# Altium project PCB_Project.PrjPcb
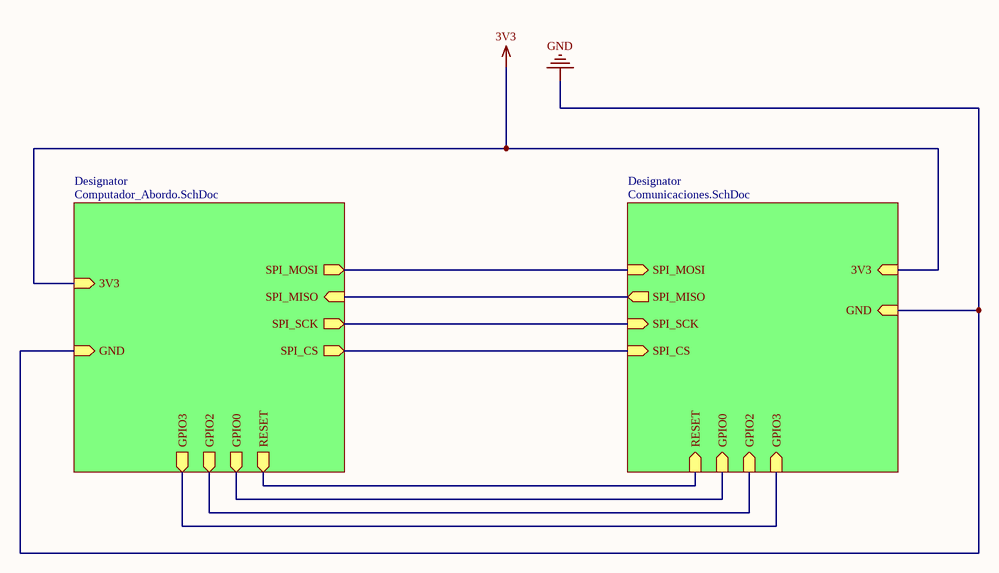
[diagram p0: Top_Sheet.SchDoc]
3 sheets, 87 parts. Net scope: hierarchical (ports join the sheet entries above them; power ports are global).
Sheets:
  Top_Sheet.SchDoc
    Designator = Computador_Abordo.SchDoc
    Designator = Comunicaciones.SchDoc

## Sheet Top_Sheet.SchDoc
size A4; SheetNumber: 1; SheetTotal: 3

### Sub-sheets
Designator = Computador_Abordo.SchDoc: SPI_CS (out), SPI_SCK (out), SPI_MISO (in), SPI_MOSI (out), RESET (out), GPIO0 (out), GPIO2 (out), GPIO3 (out), 3V3 (in), GND (in)
Designator = Comunicaciones.SchDoc: SPI_MOSI (in), SPI_MISO (out), SPI_SCK (in), SPI_CS (in), RESET (in), GPIO0 (in), GPIO2 (in), GPIO3 (in), 3V3 (in), GND (in)

### Nets
3V3: sheet Designator/3V3, sheet Designator/3V3
GND: sheet Designator/GND, sheet Designator/GND
GPIO0: sheet Designator/GPIO0, sheet Designator/GPIO0
GPIO2: sheet Designator/GPIO2, sheet Designator/GPIO2
GPIO3: sheet Designator/GPIO3, sheet Designator/GPIO3
RESET: sheet Designator/RESET, sheet Designator/RESET
SPI_CS: sheet Designator/SPI_CS, sheet Designator/SPI_CS
SPI_MISO: sheet Designator/SPI_MISO, sheet Designator/SPI_MISO
SPI_MOSI: sheet Designator/SPI_MOSI, sheet Designator/SPI_MOSI
SPI_SCK: sheet Designator/SPI_SCK, sheet Designator/SPI_SCK

## Sheet Computador_Abordo.SchDoc
size A2; SheetNumber: 2; SheetTotal: 3
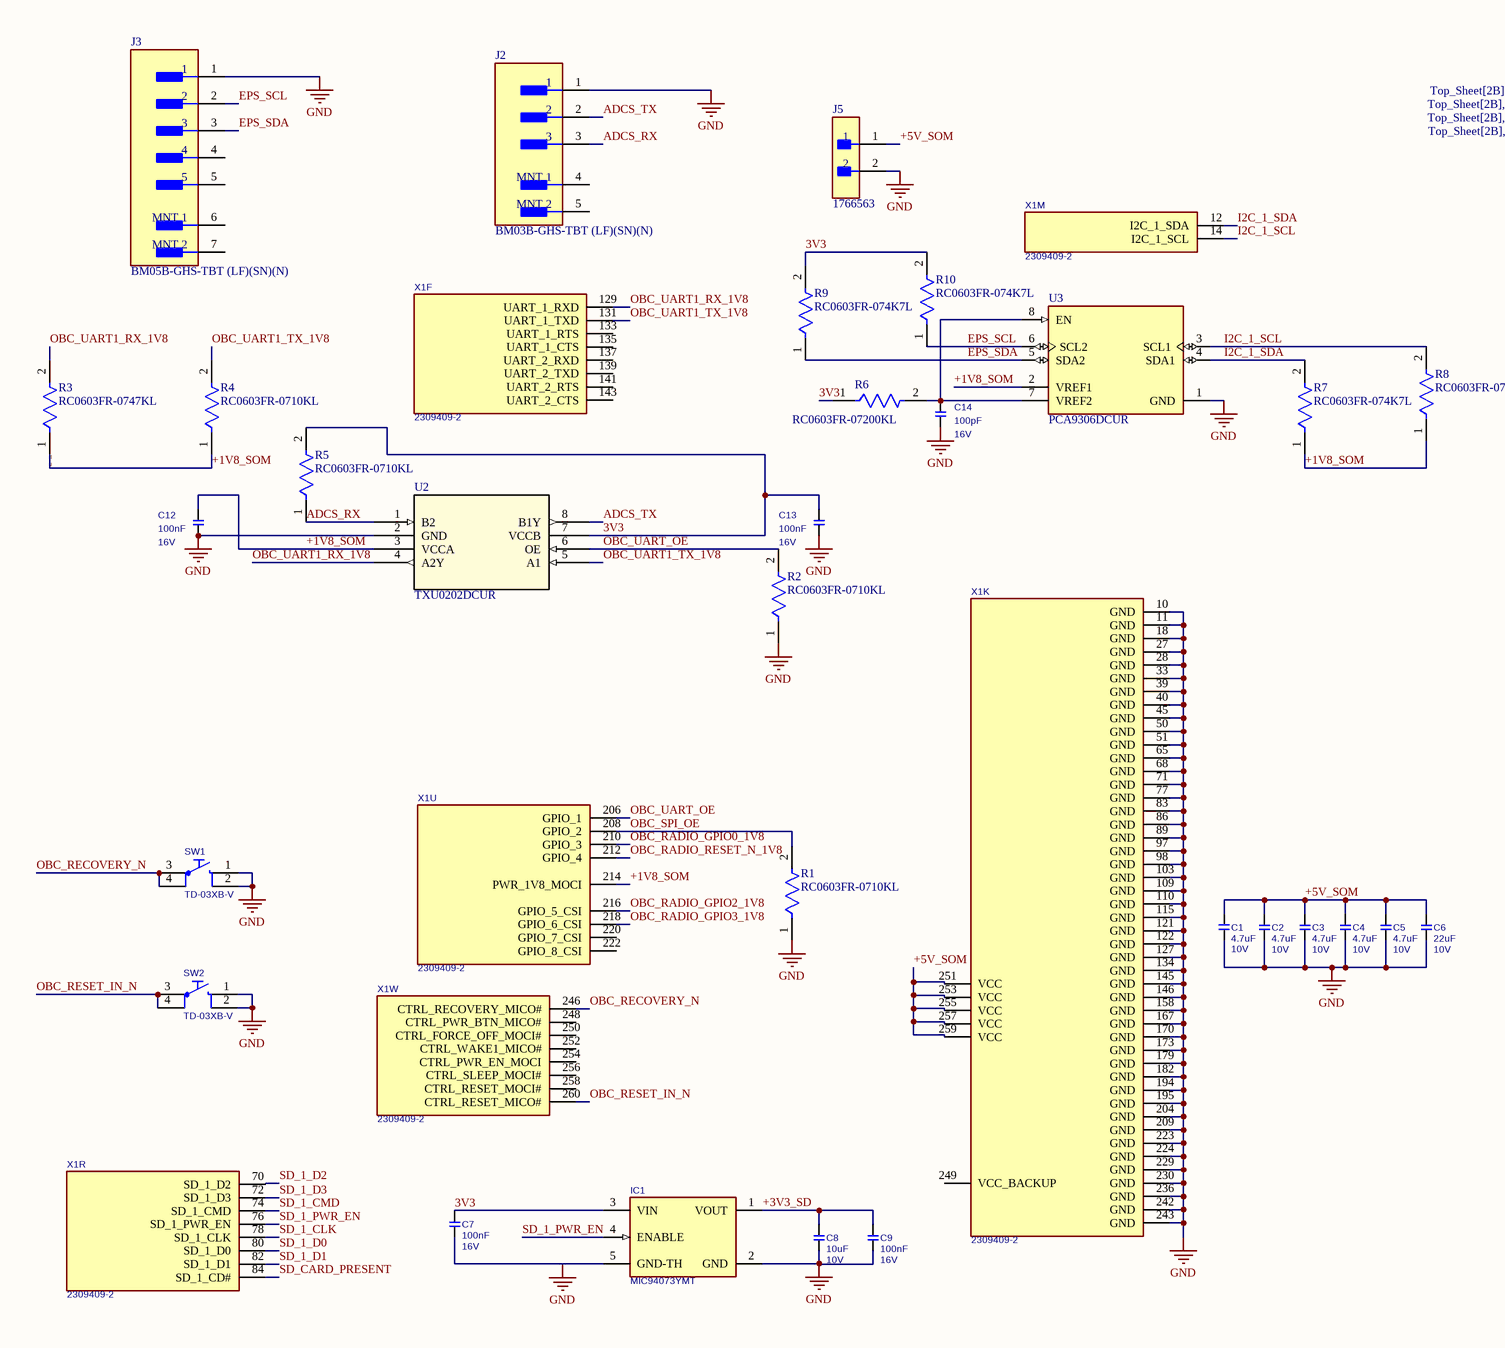
[diagram p1: Computador_Abordo.SchDoc, left]
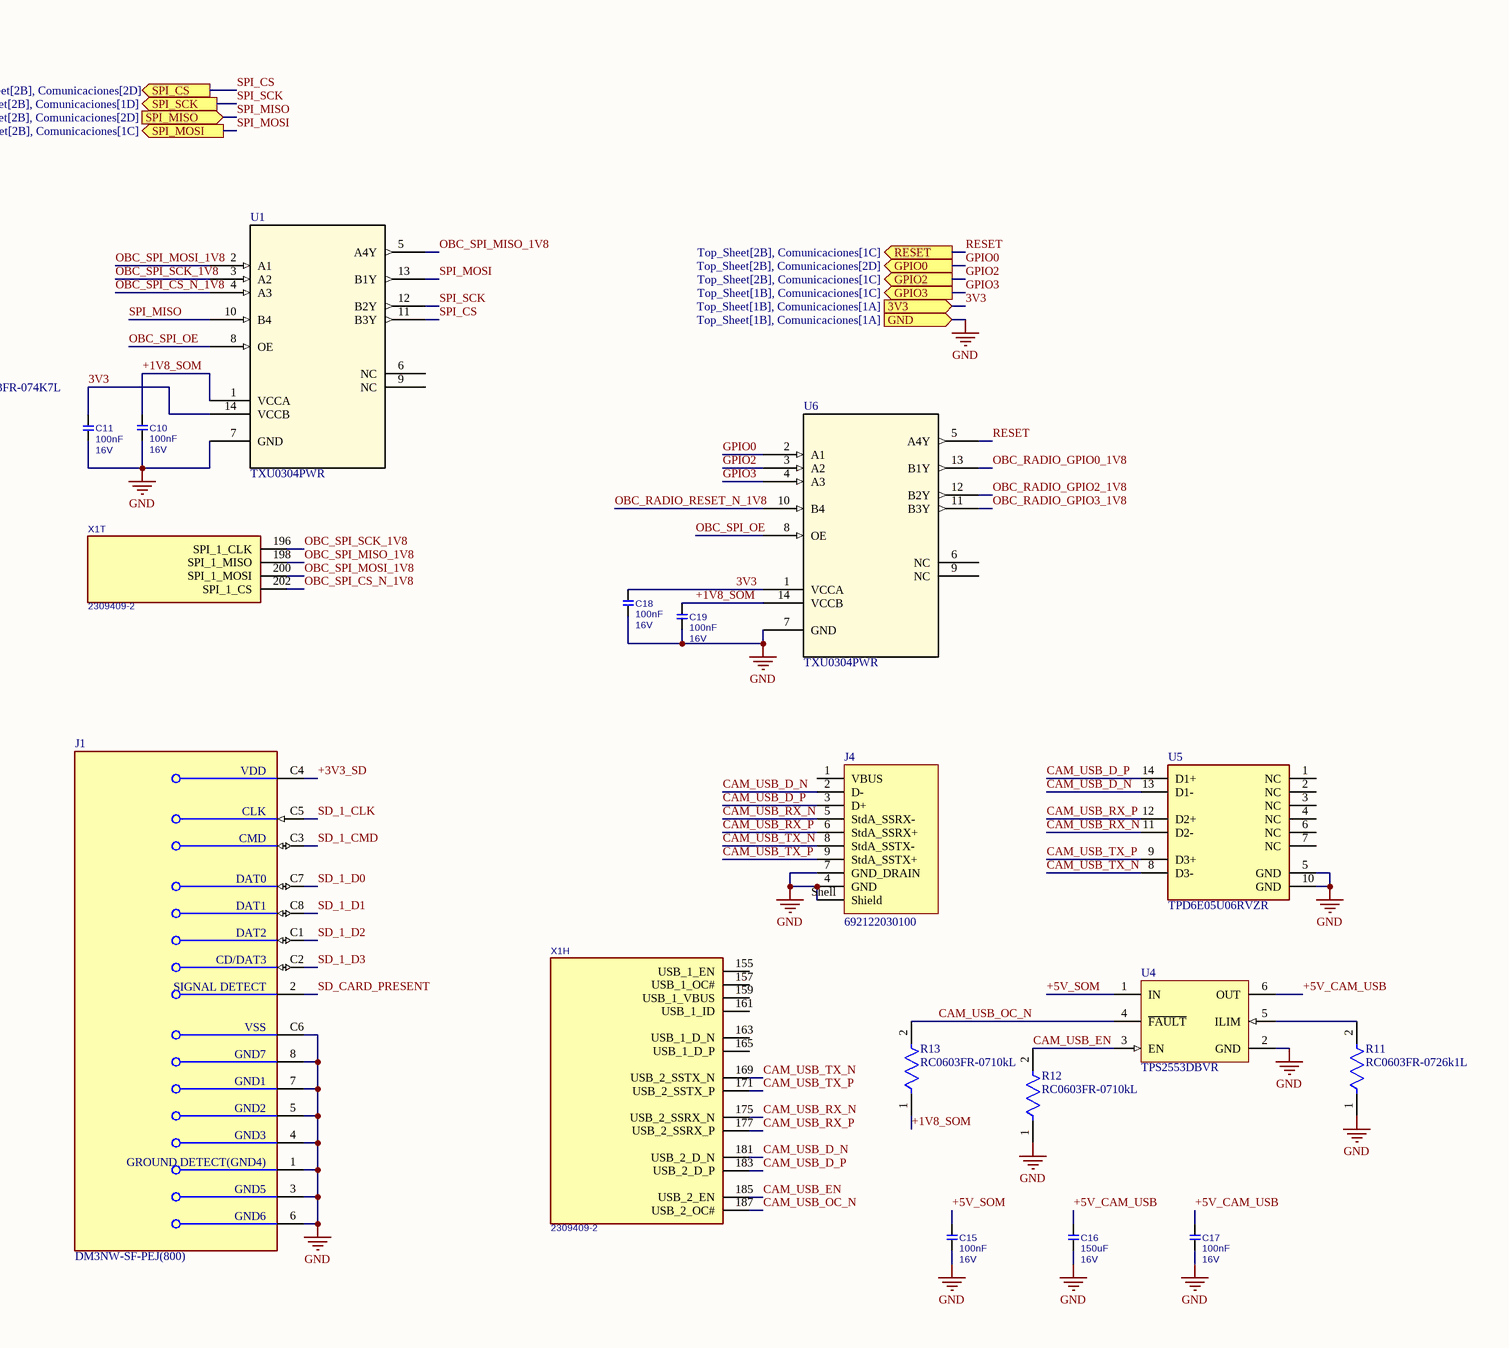
[diagram p2: Computador_Abordo.SchDoc, right]

### Parts
C1  Rating: 10V  [T_CAPC0603X33N]  (hidden comment: 4.7uF)
C2  Rating: 10V  [T_CAPC0603X33N]  (hidden comment: 4.7uF)
C3  Rating: 10V  [T_CAPC0603X33N]  (hidden comment: 4.7uF)
C4  Rating: 10V  [T_CAPC0603X33N]  (hidden comment: 4.7uF)
C5  Rating: 10V  [T_CAPC0603X33N]  (hidden comment: 4.7uF)
C6  Rating: 10V  [T_CAPC0805X125N]  (hidden comment: 22uF)
C7  Rating: 16V  [CAPC1005X60N]  (hidden comment: 100nF)
C8  Rating: 10V  [T_CAPC0603X33N]  (hidden comment: 10uF)
C9  Rating: 16V  [CAPC1005X60N]  (hidden comment: 100nF)
C10  Rating: 16V  [CAPC1005X60N]  (hidden comment: 100nF)
C11  Rating: 16V  [CAPC1005X60N]  (hidden comment: 100nF)
C12  Rating: 16V  [CAPC1005X60N]  (hidden comment: 100nF)
C13  Rating: 16V  [CAPC1005X60N]  (hidden comment: 100nF)
C14  Rating: 16V  [CAPC1005X60N]  (hidden comment: 100pF)
C15  Rating: 16V  [CAPC1005X60N]  (hidden comment: 100nF)
C16  Rating: 16V  [CAPC1005X60N]  (hidden comment: 150uF)
C17  Rating: 16V  [CAPC1005X60N]  (hidden comment: 100nF)
C18  Rating: 16V  [CAPC1005X60N]  (hidden comment: 100nF)
C19  Rating: 16V  [CAPC1005X60N]  (hidden comment: 100nF)
IC1  MIC94073YMT  [T_TDFN0P120X160X60-4N]
J1  DM3NW-SF-PEJ(800)  [FP-DM3NW-SF-PEJ_800-MFG]
J2  BM03B-GHS-TBT (LF)(SN)(N)  [FP-BM03B-GHS-TBT_LF_SN-MFG]
J3  BM05B-GHS-TBT (LF)(SN)(N)  [FP-BM05B-GHS-TBT_LF_SN-MFG]
J4  692122030100  [692122030100]
J5  1766563  [FP-1766563-MFG]
R1  RC0603FR-0710KL  [FP-RC0603-0_55-IPC_B]
R2  RC0603FR-0710KL  [FP-RC0603-0_55-IPC_B]
R3  RC0603FR-0747KL  [FP-RC0603-0_55-IPC_B]
R4  RC0603FR-0710KL  [FP-RC0603-0_55-IPC_B]
R5  RC0603FR-0710KL  [FP-RC0603-0_55-IPC_B]
R6  RC0603FR-07200KL  [FP-RC0603-0_55-IPC_B]
R7  RC0603FR-074K7L  [FP-RC0603-0_55-IPC_B]
R8  RC0603FR-074K7L  [FP-RC0603-0_55-IPC_B]
R9  RC0603FR-074K7L  [FP-RC0603-0_55-IPC_B]
R10  RC0603FR-074K7L  [FP-RC0603-0_55-IPC_B]
R11  RC0603FR-0726k1L  [FP-RC0603-0_55-IPC_B]
R12  RC0603FR-0710kL  [FP-RC0603-0_55-IPC_B]
R13  RC0603FR-0710kL  [FP-RC0603-0_55-IPC_B]
SW1  Manufacturer Part No.: TD-03XB-V  [T_WMF_TD-03XB]  (hidden comment: TD-03XB)
SW2  Manufacturer Part No.: TD-03XB-V  [T_WMF_TD-03XB]  (hidden comment: TD-03XB)
U1  TXU0304PWR  [TSSOP14_PW_TEX]
U2  TXU0202DCUR  [SO8_DCU_TEX]
U3  PCA9306DCUR  [FP-DCU0008A-MFG]
U4  TPS2553DBVR  [DBV0006A_N]
U5  TPD6E05U06RVZR  [FP-RVZ0014A-IPC_A]
U6  TXU0304PWR  [TSSOP14_PW_TEX]
X1  2309409-2  [CON-TE-2309409-2]  (parts F,H,K,M,R,T,U,W of 23)

### Ports
3V3 (in, see Top_Sheet[1B], Comunicaciones[1A]), GND (in, see Top_Sheet[1B], Comunicaciones[1A]), GPIO0 (out, see Top_Sheet[2B], Comunicaciones[2D]), GPIO2 (out, see Top_Sheet[2B], Comunicaciones[1C]), GPIO3 (out, see Top_Sheet[1B], Comunicaciones[1C]), RESET (out, see Top_Sheet[2B], Comunicaciones[1C]), SPI_CS (out, see Top_Sheet[2B], Comunicaciones[2D]), SPI_MISO (in, see Top_Sheet[2B], Comunicaciones[2D]), SPI_MOSI (out, see Top_Sheet[2B], Comunicaciones[1C]), SPI_SCK (out, see Top_Sheet[2B], Comunicaciones[1D])

### Nets
3V3: C7.2 C11.2 C13.2 C18.2 IC1.3(VIN) R5.2 R6.1 R9.2 R10.2 U1.14(VCCB) U2.7(VCCB) U6.1(VCCA) ; port 3V3
GND: C1.1 C2.1 C3.1 C4.1 C5.1 C6.1 C8.1 C9.1 C10.1 C11.1 C12.1 C13.1 C14.1 C15.1 C16.1 C17.1 C18.1 C19.1 IC1.2(GND) J1.1(GROUND_DETECT(GND4)) J1.3(GND5) J1.4(GND3) J1.5(GND2) J1.6(GND6) J1.7(GND1) J1.8(GND7) J1.C6(VSS) J2.1 J3.1 J4.4(GND) J4.7(GND_DRAIN) J4.Shell(Shield) J5.2 R1.1 R2.1 R11.1 R12.1 SW1.1 SW1.2 SW2.1 SW2.2 U1.7(GND) U2.2(GND) U3.1(GND) U4.2(GND) U5.5(GND) U5.10(GND) U6.7(GND) X1.10(GND) X1.11(GND) X1.18(GND) X1.27(GND) X1.28(GND) X1.33(GND) X1.39(GND) X1.40(GND) X1.45(GND) X1.50(GND) X1.51(GND) X1.65(GND) X1.68(GND) X1.71(GND) X1.77(GND) X1.83(GND) X1.86(GND) X1.89(GND) X1.97(GND) X1.98(GND) X1.103(GND) X1.109(GND) X1.110(GND) X1.115(GND) X1.121(GND) X1.122(GND) X1.127(GND) X1.134(GND) X1.145(GND) X1.146(GND) X1.158(GND) X1.167(GND) X1.170(GND) X1.173(GND) X1.179(GND) X1.182(GND) X1.194(GND) X1.195(GND) X1.204(GND) X1.209(GND) X1.223(GND) X1.224(GND) X1.229(GND) X1.230(GND) X1.236(GND) X1.242(GND) X1.243(GND) ; port GND
+1V8_SOM: C10.2 C12.2 C19.2 R3.1 R4.1 R7.1 R8.1 R13.1 U1.1(VCCA) U2.3(VCCA) U3.2(VREF1) U6.14(VCCB) X1.214(PWR_1V8_MOCI)  [also labelled |]
+3V3_SD: C8.2 C9.2 IC1.1(VOUT) J1.C4(VDD)
+5V_CAM_USB: C16.2 C17.2 U4.6(OUT)
+5V_SOM: C1.2 C2.2 C3.2 C4.2 C5.2 C6.2 C15.2 J5.1 U4.1(IN) X1.251(VCC) X1.253(VCC) X1.255(VCC) X1.257(VCC) X1.259(VCC)
ADCS_RX: J2.3 R5.1 U2.1(B2)
ADCS_TX: J2.2 U2.8(B1Y)
CAM_USB_D_N: J4.2(D-) U5.13(D1-) X1.181(USB_2_D_N)
CAM_USB_D_P: J4.3(D+) U5.14(D1+) X1.183(USB_2_D_P)
CAM_USB_EN: R12.2 U4.3(EN) X1.185(USB_2_EN)
CAM_USB_OC_N: R13.2 U4.4(~{FAULT}) X1.187(USB_2_OC#)
CAM_USB_RX_N: J4.5(StdA_SSRX-) U5.11(D2-) X1.175(USB_2_SSRX_N)
CAM_USB_RX_P: J4.6(StdA_SSRX+) U5.12(D2+) X1.177(USB_2_SSRX_P)
CAM_USB_TX_N: J4.8(StdA_SSTX-) U5.8(D3-) X1.169(USB_2_SSTX_N)
CAM_USB_TX_P: J4.9(StdA_SSTX+) U5.9(D3+) X1.171(USB_2_SSTX_P)
EPS_SCL: J3.2 R10.1 U3.6(SCL2)
EPS_SDA: J3.3 R9.1 U3.5(SDA2)
GPIO0: U6.2(A1) ; port GPIO0
GPIO2: U6.3(A2) ; port GPIO2
GPIO3: U6.4(A3) ; port GPIO3
I2C_1_SCL: R8.2 U3.3(SCL1) X1.14(I2C_1_SCL)
I2C_1_SDA: R7.2 U3.4(SDA1) X1.12(I2C_1_SDA)
OBC_RADIO_GPIO0_1V8: U6.13(B1Y) X1.210(GPIO_3)
OBC_RADIO_GPIO2_1V8: U6.12(B2Y) X1.216(GPIO_5_CSI)
OBC_RADIO_GPIO3_1V8: U6.11(B3Y) X1.218(GPIO_6_CSI)
OBC_RADIO_RESET_N_1V8: U6.10(B4) X1.212(GPIO_4)
OBC_RECOVERY_N: SW1.3 SW1.4 X1.246(CTRL_RECOVERY_MICO#)
OBC_RESET_IN_N: SW2.3 SW2.4 X1.260(CTRL_RESET_MICO#)
OBC_SPI_CS_N_1V8: U1.4(A3) X1.202(SPI_1_CS)
OBC_SPI_MISO_1V8: U1.5(A4Y) X1.198(SPI_1_MISO)
OBC_SPI_MOSI_1V8: U1.2(A1) X1.200(SPI_1_MOSI)
OBC_SPI_OE: R1.2 U1.8(OE) U6.8(OE) X1.208(GPIO_2)
OBC_SPI_SCK_1V8: U1.3(A2) X1.196(SPI_1_CLK)
OBC_UART1_RX_1V8: R3.2 U2.4(A2Y) X1.129(UART_1_RXD)
OBC_UART1_TX_1V8: R4.2 U2.5(A1) X1.131(UART_1_TXD)
OBC_UART_OE: R2.2 U2.6(OE) X1.206(GPIO_1)
RESET: U6.5(A4Y) ; port RESET
SD_1_CLK: J1.C5(CLK) X1.78(SD_1_CLK)
SD_1_CMD: J1.C3(CMD) X1.74(SD_1_CMD)
SD_1_D0: J1.C7(DAT0) X1.80(SD_1_D0)
SD_1_D1: J1.C8(DAT1) X1.82(SD_1_D1)
SD_1_D2: J1.C1(DAT2)
SD_1_D3: J1.C2(CD/DAT3) X1.72(SD_1_D3)
SD_1_PWR_EN: IC1.4(ENABLE) X1.76(SD_1_PWR_EN)
SD_CARD_PRESENT: J1.2(SIGNAL_DETECT) X1.84(SD_1_CD#)
SPI_CS: U1.11(B3Y) ; port SPI_CS
SPI_MISO: U1.10(B4) ; port SPI_MISO
SPI_MOSI: U1.13(B1Y) ; port SPI_MOSI
SPI_SCK: U1.12(B2Y) ; port SPI_SCK
NetC7_1: C7.1 IC1.5(GND-TH)
NetC14_2: C14.2 R6.2 U3.7(VREF2) U3.8(EN)
NetR11_2: R11.2 U4.5(ILIM)

Not connected (* = marked no-connect by the designer): J2 4(MNT_1) 5(MNT_2); J3 4 5 6(MNT_1) 7(MNT_2); J4 1(VBUS); U1 6(NC) 9(NC); U5 1(NC) 2(NC) 3(NC) 4(NC) 6(NC) 7(NC); U6 6(NC) 9(NC); X1 70(SD_1_D2) 133(UART_1_RTS) 135(UART_1_CTS) 137(UART_2_RXD) 139(UART_2_TXD) 141(UART_2_RTS) 143(UART_2_CTS) 155(USB_1_EN) 157(USB_1_OC#) 159(USB_1_VBUS) 161(USB_1_ID) 163(USB_1_D_N) 165(USB_1_D_P) 220(GPIO_7_CSI) 222(GPIO_8_CSI) 248(CTRL_PWR_BTN_MICO#) 249(VCC_BACKUP) 250(CTRL_FORCE_OFF_MOCI#) 252(CTRL_WAKE1_MICO#) 254(CTRL_PWR_EN_MOCI) 256(CTRL_SLEEP_MOCI#) 258(CTRL_RESET_MOCI#)

### Notes on the sheet
- Labels drawn without touching a wire or pin: GND

### Library data of the parts
C1-C5 = C-X5R-4.7uF-10V-10%-0603: Capacitor Ceramic X5R 4.7uF 10V 10% 0603; Tolerance: 10%; Type: X5R; Value: 4.7uF
C6 = C-X5R-22uF-10V-20%-0805: Capacitor Ceramic X5R 22uF 10V 20% 0805; Tolerance: 20%; Type: X5R; Value: 22uF
C7 C9-C19 = C-X7R-100nF-16V-10%-0402: Capacitor Ceramic X7R 100nF 16V 10% 0402; Tolerance: 10%; Type: X7R
  C7 C9-C13 C15 C17-C19: Value: 100nF
  C14: Value: 100pF
  C16: Value: 150uF
C8 = C-X5R-10uF-10V-20%-0603: Capacitor Ceramic X5R 10uF 10V 20% 0603; Tolerance: 20%; Type: X5R; Value: 10uF
IC1 = IC-Microchip-MIC94073YMT: High Side Load Switch, TDFN4 1.2 x 1.6; Manufacturer Name: Microchip; Package: TDFN-4; Manufacturer Part No.: MIC94073YMT
J1 = CMP-11597-000007-1: CONN MICROSD CARD PUSH-PUSH SMD; RoHS Compliant: Yes
J2 = CMP-17439-000616-1: CONN HEADER SMD 3POS 1.25MM; Mated Stacking Heights: 7.3mm; Voltage Rating: 50V; Pitch: 0.049inch; Number of Positions: 3; Contact Material: Bronze; Number of Rows: 1; Packaging: Cut Tape; Fastening Type: Ramp; Contact Shape: Rectangular; Termination: Solder; Flammability Rating: UL94 V-0; Lead Free: Lead Free; Color: Natural; Mount: Surface Mount; Contact Finish - Mating: TIN; Max Operating Temperature: 85°C; Series: GH; Insulation Color: Natural; Connector Type: Header; Insulation Material: Nylon; Contact Type: Outer Shroud Contact; Min Operating Temperature: -25°C; Contact Plating: Tin
J3 = CMP-17439-000467-1: CONN HEADER SMD 5POS 1.25MM; Pitch: 0.049inch; Number of Positions: 5; Mated Stacking Heights: 7.3mm; Voltage Rating: 50V; Contact Material: Bronze; Number of Pins: 5; Contact Type: Outer Shroud Contact; Lead Free: Lead Free; Insulation Material: Nylon; Flammability Rating: UL94 V-0; Min Operating Temperature: -25°C; Series: GH; Mount: Surface Mount; Number of Rows: 1; Color: Natural; Packaging: Cut Tape; Contact Shape: Rectangular; Contact Plating: Tin; Contact Finish - Mating: TIN; Connector Type: Header; Insulation Color: Natural; Fastening Type: Ramp; Termination: Solder; Max Operating Temperature: 85°C
J4 = CMP-1502-03220-3: Conn USB 3.0 Type A RCP 9 POS 1.25mm Solder RA SMD 9 Terminal 1 Port T/R; Current Rating: 250mA; Insulation Resistance: 100MΩ; Number of Contacts: 9; Number of Ports: 1; Voltage Rating (AC): 30V; USB Standard: USB 3.0; Gender: Receptacle; Contact Resistance: 50mΩ; RoHS: Compliant; Min Operating Temperature: -20°C; Packaging: Tape and Reel; Width: 16.66mm; Contact Plating: Gold; Color: Blue; Height: 8.01mm; Mount: Horizontal, Surface Mount, Through Hole; Voltage Rating: 30V; Contact Material: Gold, Nickel; Connector Type: USB; REACH SVHC: Unknown; Number of Pins: 9; Max Operating Temperature: 85°C; Operating Supply Voltage: 30V; Lead Free: Lead Free; Termination: SMD/SMT; Orientation: Horizontal; Flammability Rating: UL94 V-0; Features: Shielded; Length: 15.1mm
J5 = CMP-09399-000002-1: TERM BLOCK HDR 2POS VERT 7.62MM; Manufacturer: Phoenix Contact; Conn Gender: Male; Number Of Contacts: 2; Conn Orientation: Straight; Voltage Rating: 630V; Current Rating: 12A; Package: 1766563; Device Class L3: unset; Pitch: 7.62mm; Contact Material: Tin; Height: 12.15mm; Digikey Description: TERM BLOCK HDR 2POS VERT 7.62MM; RoHS: TRUE; Category: Conn; Octopart: https://octopart.com/1766563-phoenix+contact-859397; Lead Free: Yes; Number Of Rows: 1; Footprint Url: https://www.phoenixcontact.com/online/portal/us/pxc/product_detail_page/!ut/p/z1/3Vffc6IwEP5X7INvjVkCBLyZe8AftfaqtVVb4YUJIdrcCVhAbfvXX1B753hz-tBx5g4mA0l299vsJl9mwR6eYC9mKzljuUxiNldj16P-qDFqtweEanf3ZgO6LbPZvjUetOs-wY_Yw17OAuxqRW8ug5Slb9hdZiIuJhYyVCKLUpPqxTiZDprNb9gdIE1DQNR7AyDzucDulRAhyp_TZDl7rjwLFoq0giqd3nDUeKyQS7MKFYI6yLqkRM1_oD4dXaOjHBwPYWsPf3kcOGXvKnvLJx0NtGtD68GtZcE9uXIIaQ2cEWh4uElEOJ2zeLZkMxXoZiLJZJHl7SgVXMiVSHcyzn8c5ujP1KZJuOQFxEi85lvD3zuh_EVJ-OHrYBd2pi2RMznPurmIunsKJwLSSxZQB8oWEClbQGXjUKdsHLLLxiG7bByyy8ahu9IdubJdCnf0vwtIKSxTid3FK0cJR1KJw43mF4Xz9UPrBnsyiGprHtWgplRrO1B_q-svikifGtgdayKerVWF6R0tIh1tp3CkCB2K2B8P_cGkOR4ez3vrgeKnlRRrPI6TNFJV_HYXeJGJEGwQBliIhcREhkUEYlDnKIC6YQvDmBIw8TWc8mB-0sMJeOus8NZ54fvnTc6VcV74z67-5uhRvzWKf0r5_eXFc7DHkzgvCDwpiF2FtQiqEDGpujtGZVWYyyzfMEr1FzzwlU0seJ6kmb_4dUtUIeSmbTFqocA0ABmUUsQIGEgInQR0aml63caLKLL1oqHx5H0kgve9ZoO-E26b3--bq_32Dxr0kVfvok4zsHtt3ZxF_sEncy4ufgLJYhWE/p0/IZ7_2G101H41M0L770Q2FA22DPAT82=CZ6_TBTEEP261OQ5B0ID5CEL4R1HN2=LA0=EdownloadId!4187324=action!downloadFile==/#Z7_2G1; Device Class L1: Connectors; Automotive: No; ComponentLink2Description: Datasheet; ComponentLink2URL: https://www.phoenixcontact.com/pxc-oc-itemdetail-pdf-web/eshop?lineItemType=LineItem&UID=1766563; Device Class L2: Headers and Wire Housings; Manufacturer Part Number: 1766563; Mouser Description: Pluggable Terminal Blocks 2 Pos 7.62mm pitch Through Hole Header
R1-R13 = CMP-2100-03664-2: RES 10K OHM 1% 1/10W 0603; Voltage Rating: 75V; Voltage Rating (DC): 50V; Resistance: 10kR; Power Rating: 100mW; Temperature Coefficient: 100ppm/°C; Depth: 0.8mm; Termination: SMD/SMT; Resistor Type: Thick Film; Series: RC; Construction: Rectangular; Features: Moisture Resistant; Packaging: Tape and Reel; Min Operating Temperature: -55°C; Number of Terminations: 2; Lead Pitch: 0.3mm; RoHS Compliant: Yes; Case/Package: 0603; Resistance Tolerance: 1%; Military Standard: Not; Weight: 7.1E-05oz; Number of Pins: 2; Tolerance: 1%; Length: 1.6mm; Case Code (Imperial): 0603; Lead Free: Lead Free; Width: 0.8mm; Max Power Dissipation: 100mW; Height: 0.45mm; Max Operating Temperature: 155°C; Case Code (Metric): 1608; Size Code: 0603
SW1 SW2 = SW-WMF-TD-03XB: Push Button; Manufacturer Name: Wealth Metal; Rating: 50mA
U1 U6 = TXU0304PWR: Four-channel fixed multidirectional level shifter 14-TSSOP -40 to 125; Manufacturer_Name: Texas Instruments; Copyright: Copyright (C) 2026 Ultra Librarian. All rights reserved.; Manufacturer_Part_Number: TXU0304PWR; RefDes: RefDes; Type: Type
U2 = TXU0202DCUR: Two channel fixed-direction level shifter with channels in opposite direction 8-VSSOP -40 to 125; Manufacturer_Name: Texas Instruments; Copyright: Copyright (C) 2026 Ultra Librarian. All rights reserved.; Manufacturer_Part_Number: TXU0202DCUR; RefDes: RefDes; Type: Type
U3 = CMP-0314-00419-3: IC TRNSLTR BIDIRECTIONAL 8VSSOP; Output Type: I2C; Max Supply Voltage: 5V; Number of Outputs: 2; Min Supply Voltage: 0uV; Logic Function: Translator; Turn-On Delay Time: 1.2ns; Output Current: 64mA; Propagation Delay: 1.4ns; Height: 0.85mm; Case/Package: VSSOP; Min Operating Temperature: -40°C; Weight: 0.000339oz; Packaging: Tape and Reel; Number of Pins: 8; Package Quantity: 1; Contact Plating: Gold; Termination: SMD/SMT; Max Operating Temperature: 85°C; Radiation Hardening: No; Number of Bits: 2; REACH SVHC: No SVHC; Lead Free: Lead Free; Number of Channels: 2; Length: 2.3mm; Number of Inputs: 2; Width: 2mm
U4 = CMP-0337-00284-2: Adjustable, Active High, Constant-Current, Current-Limited Power-Distribution Switch, 0.075 to 1.7 A Current Limit, -40 to 85 degC, 6-pin SOT-23 (DBV), Green (RoHS & no Sb/Br); Manufacturer: Texas Instruments; Continuous Current(Max)(A): 1.5; Vin(Min)(V): 2.5; Current Limit Accuracy @ 1A: +/-7.5% (925mA min / 1075mA max); Vin(Max)(V): 6.5; Rating: Catalog; rDS(on) per FET(Typ)(mOhms): 100/DRV, 85/DBV; Number of Switches: 1; ComponentLink1Description: Datasheet; PartNumber: TPS2553DBVR; Enable: Active High; PackageDescription: 6-Pin Plastic Small-Outline Package, 2.9 x 1.6 mm Body, 0.95 mm Pitch, 2.8 mm Lead Span; DatasheetVersion: SLVS841E; Code_JEDEC: MO-178-AB*; Current Limit Topology: Constant-Current; Mounting Technology: Surface Mount; Eco-Plan: Green (RoHS & no Sb/Br); PackageVersion: revK, Mar-2006; PackageReference: DBV0006A; ComponentLink1URL: http://www.ti.com/general/docs/lit/getliterature.tsp?genericPartNumber=TPS2553&fileType=pdf; Current Limit(A): 0.075 to 1.7
U5 = CMP-04985-000017-1: TVS DIODE 5.5V 14V 14USON; Number of Channels: 6; Peak Pulse Current: 2.5A; Polarity: Bidirectional; Interface: LVDS; Leakage Current: 10nA; Direction: Unidirectional; Power Line Protection: Yes; Breakdown Voltage: 6V; Max Power Dissipation: 40W; Min Operating Temperature: -40°C; Working Voltage: 5.5V; Number of Pins: 14; Termination: SMD/SMT; Number of Bidirectional Channels: 6; Reverse Standoff Voltage: 5.5V; Package Quantity: 3000; Mount: Surface Mount; Max Operating Temperature: 125°C; Radiation Hardening: No; Length: 3.6mm; RoHS Compliant: Yes; Lead Free: Lead Free; Packaging: Tape and Reel; Min Breakdown Voltage: 6V; Clamping Voltage: 14V; Peak Pulse Power: 40W; Depth: 1.45mm
X1 = CON-TE-2309409-2: DDR4 SODIMM Socket, 260 pins, 5.2mm(H), 0.5mm Pitch; Manufacturer Name: TE Connectivity; Manufacturer Part No.: 2309409-2; Temperature Range: -40C to +125C; Package: DDR4-SODIMM-260

## Sheet Comunicaciones.SchDoc
size A4; SheetNumber: 3; SheetTotal: 3
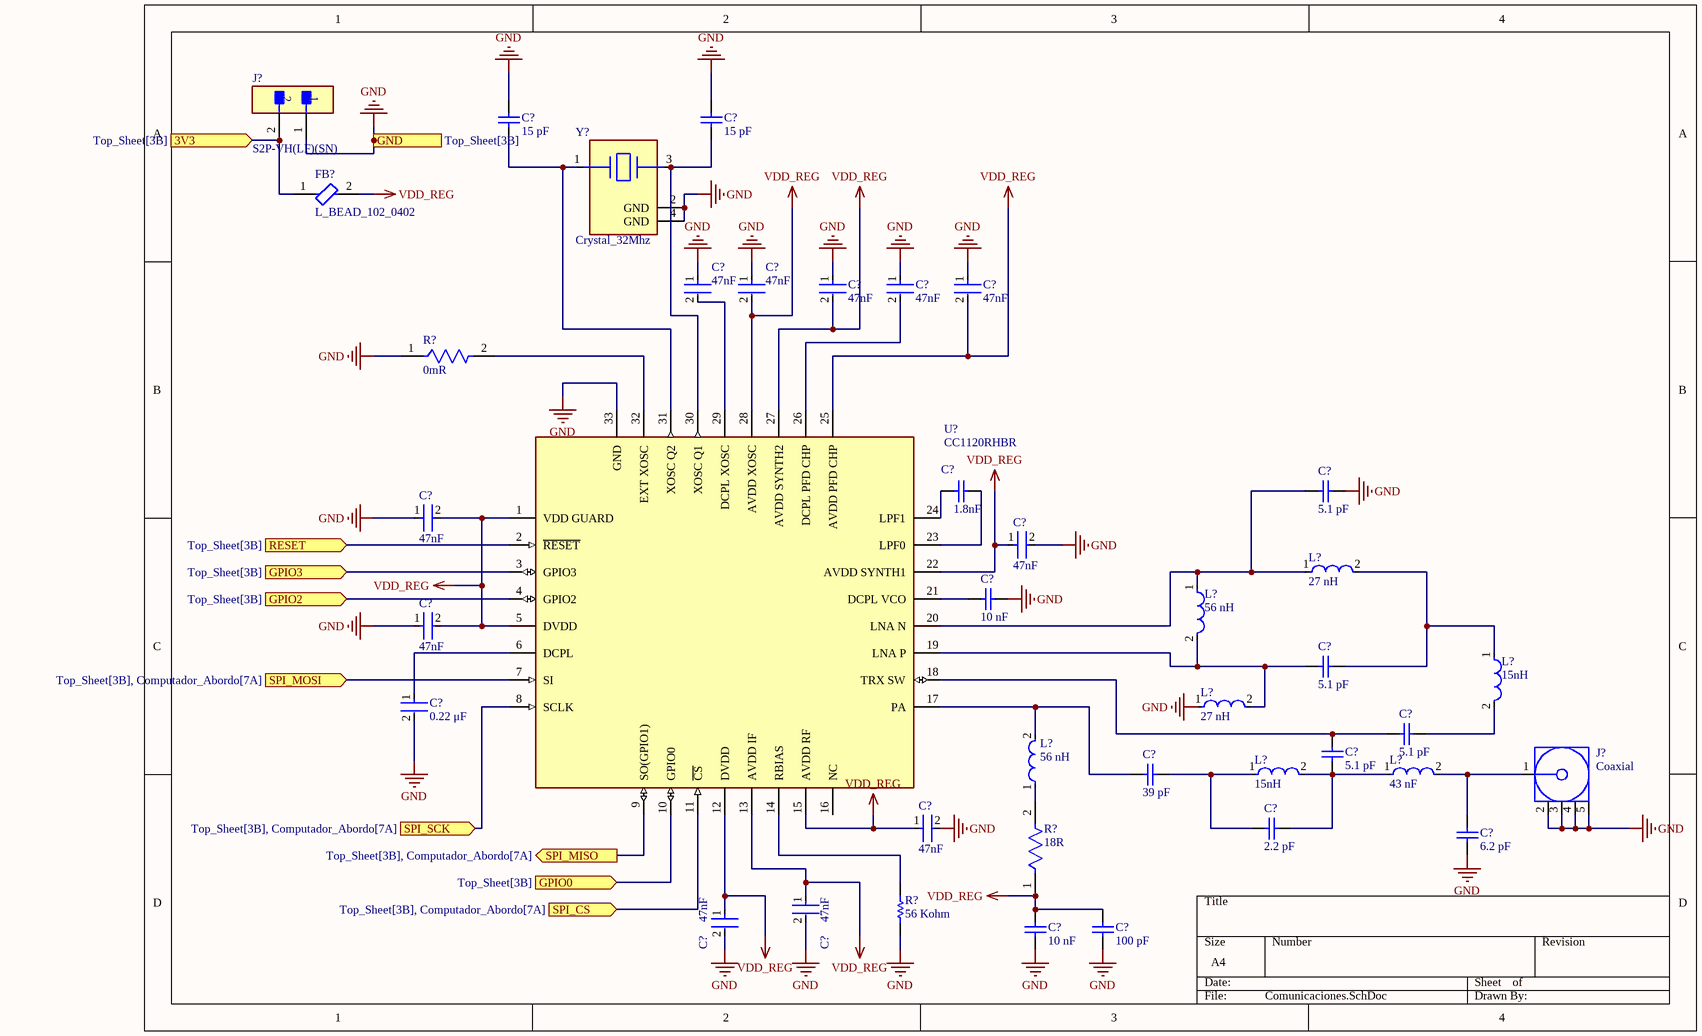
[diagram p3: Comunicaciones.SchDoc]

### Parts
(Parts that share a designator on the sheet are numbered #1, #2 ... from top to bottom, then left to right.)
C?#1  15 pF  [CAPC1005X55X25LL05T10]
C?#2  15 pF  [CAPC1005X55X25LL05T10]
C?#3  47nF  [FP-GRM155-0_05-IPC_A]
C?#4  47nF  [FP-GRM155-0_05-IPC_A]
C?#5  47nF  [FP-GRM155-0_05-IPC_A]
C?#6  47nF  [FP-GRM155-0_05-IPC_A]
C?#7  47nF  [FP-GRM155-0_05-IPC_A]
C?#8  1.8nF  [CAPC1005X55X25LL05T10]
C?#9  5.1 pF  [CAPC1005X55X25LL05T10]
C?#10  47nF  [FP-GRM155-0_05-IPC_A]
C?#11  47nF  [FP-GRM155-0_05-IPC_A]
C?#12  10 nF  [CAPC1005X55X25LL05T10]
C?#13  47nF  [FP-GRM155-0_05-IPC_A]
C?#14  5.1 pF  [CAPC1005X55X25LL05T10]
C?#15  0.22 μF  [FP-C0603C-CF-IPC_B]
C?#16  5.1 pF  [CAPC1005X55X25LL05T10]
C?#17  5.1 pF  [CAPC1005X55X25LL05T10]
C?#18  39 pF  [CAPC1005X55X25LL05T10]
C?#19  2.2 pF  [CAPC1005X55X25LL05T10]
C?#20  47nF  [FP-GRM155-0_05-IPC_A]
C?#21  6.2 pF  [CAPC1005X60X25ML10T15]
C?#22  47nF  [FP-GRM155-0_05-IPC_A]
C?#23  47nF  [FP-GRM155-0_05-IPC_A]
C?#24  100 pF  [CAPC1005X55X25LL05T10]
C?#25  10 nF  [CAPC1005X55X25LL05T10]
FB?  L_BEAD_102_0402  [FP-BLM15-0_05-IPC_C]
J?#1  S2P-VH(LF)(SN)  [FP-S2P-VH_LF_SN-MFG]
J?#2  Coaxial  [60312202114512]
L?#1  27 nH  [FP-LQW15AN_00-W0_5-0_1-MFG]
L?#2  56 nH  [FP-LQW15AN_00-W0_5-0_1-MFG]
L?#3  15nH  [FP-LQW15AN_00-W0_6-0_1-MFG]
L?#4  27 nH  [FP-LQW15AN_00-W0_5-0_1-MFG]
L?#5  15nH  [FP-LQW15AN_00-W0_6-0_1-MFG]
L?#6  43 nF  [FP-LQW15AN_00-W0_5-0_1-MFG]
L?#7  56 nH  [FP-LQW15AN_00-W0_5-0_1-MFG]
R?#1  0mR  [FP-RK73Z1E-IPC_B]
R?#2  18R  [FP-RMCF0402-IPC_B]
R?#3  56 Kohm  [RESC1005X40X25ML10T10]
U?  CC1120RHBR  [FP-RHB0032E-MFG]
Y?  Crystal_32Mhz  [FP-ABM10W-MFG]

### Ports
3V3 (in, see Top_Sheet[3B]), GND (in, see Top_Sheet[3B]), GPIO0 (in, see Top_Sheet[3B]), GPIO2 (in, see Top_Sheet[3B]), GPIO3 (in, see Top_Sheet[3B]), RESET (in, see Top_Sheet[3B]), SPI_CS (in, see Top_Sheet[3B], Computador_Abordo[7A]), SPI_MISO (out, see Top_Sheet[3B], Computador_Abordo[7A]), SPI_MOSI (in, see Top_Sheet[3B], Computador_Abordo[7A]), SPI_SCK (in, see Top_Sheet[3B], Computador_Abordo[7A])

### Nets
3V3: FB?.1 J?#1.2 ; port 3V3
GND: C?#1.2 C?#2.2 C?#3.1 C?#4.1 C?#5.1 C?#6.1 C?#7.1 C?#9.1 C?#10.1 C?#11.2 C?#12.2 C?#13.1 C?#15.2 C?#20.2 C?#21.1 C?#22.2 C?#23.2 C?#24.2 C?#25.1 J?#1.1 J?#2.2(GND) J?#2.3(GND) J?#2.4(GND) J?#2.5(GND) L?#4.1 R?#1.1 R?#3.1 U?.33(GND) Y?.2(GND) Y?.4(GND) ; port GND
VDD_REG: C?#4.2 C?#5.2 C?#7.2 C?#10.2 C?#11.1 C?#13.2 C?#20.1 C?#22.1 C?#23.1 C?#24.1 C?#25.2 FB?.2 R?#2.1 U?.1(VDD_GUARD) U?.5(DVDD) U?.12(DVDD) U?.13(AVDD_IF) U?.15(AVDD_RF) U?.22(AVDD_SYNTH1) U?.25(AVDD_PFD_CHP) U?.27(AVDD_SYNTH2) U?.28(AVDD_XOSC)
GPIO0: U?.10(GPIO0) ; port GPIO0
GPIO2: U?.4(GPIO2) ; port GPIO2
GPIO3: U?.3(GPIO3) ; port GPIO3
RESET: U?.2(~{RESET}) ; port RESET
SPI_CS: U?.11(~{CS}) ; port SPI_CS
SPI_MISO: U?.9(SO(GPIO1)) ; port SPI_MISO
SPI_MOSI: U?.7(SI) ; port SPI_MOSI
SPI_SCK: U?.8(SCLK) ; port SPI_SCK
NetC?#1_1: C?#1.1 U?.31(XOSC_Q2) Y?.1
NetC?#2_1: C?#2.1 U?.30(XOSC_Q1) Y?.3
NetC?#3_2: C?#3.2 U?.29(DCPL_XOSC)
NetC?#6_2: C?#6.2 U?.26(DCPL_PFD_CHP)
NetC?#8_1: C?#8.1 U?.23(LPF0)
NetC?#8_2: C?#8.2 U?.24(LPF1)
NetC?#9_2: C?#9.2 L?#1.1 L?#2.1 U?.20(LNA_N)
NetC?#12_1: C?#12.1 U?.21(DCPL_VCO)
NetC?#14_1: C?#14.1 L?#1.2 L?#3.1
NetC?#14_2: C?#14.2 L?#2.2 L?#4.2 U?.19(LNA_P)
NetC?#15_1: C?#15.1 U?.6(DCPL)
NetC?#16_1: C?#16.1 C?#17.2 U?.18(TRX_SW)
NetC?#16_2: C?#16.2 C?#19.2 L?#5.2 L?#6.1
NetC?#17_1: C?#17.1 L?#3.2
NetC?#18_1: C?#18.1 L?#7.2 U?.17(PA)
NetC?#18_2: C?#18.2 C?#19.1 L?#5.1
NetC?#21_2: C?#21.2 J?#2.1(Signal) L?#6.2
NetL?#7_1: L?#7.1 R?#2.2
NetR?#1_2: R?#1.2 U?.32(EXT_XOSC)
NetR?#3_2: R?#3.2 U?.14(RBIAS)

Not connected (* = marked no-connect by the designer): U? 16(NC)

### Library data of the parts
C?#1 C?#2 = C_15P_0402_NP0_J_50: Part Number: GRM1555C1H150JZ01D; Manufacturer: Murata; Value: 15 pF
C?#3-C?#7 C?#10 C?#11 C?#13 C?#20 C?#22 C?#23 = C_47N_0402_X7R_K_25: Chip Multilayer Ceramic Capacitors for General Purpose, 0402, 47000pF, X7R, 15%, 10%, 25V; Depth: 0.5mm; Capacitance: 47nF; Case/Package: 0402; Tolerance: 10%; REACH SVHC: No SVHC; Termination: SMD/SMT; Number of Pins: 2; Mount: Surface Mount; Radiation Hardening: No; Height: 0.5mm; Min Operating Temperature: -55°C; Max Operating Temperature: 125°C; Thickness: 0.022inch; Length: 1mm; Voltage Rating (DC): 25V; Material: Ceramic; Lead Free: Lead Free; Packaging: Tape and Reel; Dielectric: X7R; Voltage: 25V; Case Code (Metric): 1005; Width: 0.02inch; Case Code (Imperial): 0402; Voltage Rating: 25V; Package Quantity: 1
C?#8 = C_1N8_0402_U2J_J_10: GRM1557U1A182JA01D; Manufacturer: Murata; Part Number: GRM1557U1A182JA01D; Value: 1.8nF
C?#9 C?#14 C?#16 C?#17 = C_5P1_0402_NP0_C_50: Part Number: GRM1555C1H5R1CZ01D; Manufacturer: Murata; Value: 5.1 pF
C?#12 C?#25 = C_10N_0402_X7R_K_25: Manufacturer: Murata; Part Number: GRM155R71E103KA01D; Value: 10 nF
C?#15 = C_220N_0402_X5R_K_10: C0603 0.22 μF X7R 30ppm/°C 10.00% 10 V; Manufacturer Part Number: C0603C224K8RAC; Manufacturer: KEMET; Automotive Grade: Grade 1; Material: Ceramic; Voltage Rating: 10 V; Tolerance: 0.1; Capacitance: 0.22 μF; Device Class L2: Capacitors; Temperature Range High: +125°C; RoHS: TRUE; Device Class L1: Passive Components; Temperature: -55°C to +125°C; Temperature Coefficient: 30ppm/°C; ComponentLink2Description: Datasheet; Device Class L3: Ceramic Capacitors; ComponentLink2URL: https://api.kemet.com/component-edge/download/datasheet/C0603C100J5GACAUTO.pdf; Value: 0.22 μF; Category: Cap; Lead Free: Yes; Automotive: Yes; Height: 0.87mm; Temperature Characteristic: X7R; Mouser Description: Multilayer Ceramic Capacitors MLCC - SMD/SMT 50volts 0.22 uF C0G X7R; Octopart: https://octopart.com/c0603c224k8rac-kemet-7455784; Package: C0603C-CF; Temperature Range Low: -55°C
C?#18 = C_39P_0402_NP0_J_50: Chip Capacitor, 39 pF, +/- 5%, 50 V, -55 to 125 degC, 0402 (1005 Metric), RoHS, Tape and Reel; PartNumber: GRM1555C1H390JZ01D; Voltage Rating (DC): 50 V; Type (Capacitors): C0G; Case\/Package: 0402; Length: 0.039 inch; RoHSCompliant: true; ComponentLink1URL: http://www.murata.com/; Packaging: Tape and Reel; Lead Pitch: 2 mm; PackageDescription: 2-Pin Surface Mount Device, Body 1 x 0.5 mm; PackageReference: 0402; Case Code (Metric): 1005; Pins: 2; Capacitance: 39 pF; Mounting Technology: Surface Mount; DatasheetVersion: 09/2016; REACH SVHC: No SVHC; Radiation Hardening: No; ComponentLink2Description: Datasheet; ComponentLink1Description: Manufacturer URL; Height: 0.5 mm; Package Quantity: 10000; Case Code (Imperial): 0402; Width: 0.02 inch; ComponentLink2URL: http://psearch.en.murata.com/capacitor/product/GRM1555C1H390JZ01_.pdf; Voltage Rating: 50 V; Max Operating Temperature: 125 degC; Min Operating Temperature: -55 degC; Mount: Surface Mount; Tolerance: 5%
C?#19 = C_2P2_0402_NP0_C_50: Manufacturer: Murata; Part Number: GRM1555C1H2R2CZ01D; Value: *
C?#21 = C_6P2_0402_NP0_C_50: Manufacturer: AVX Interconnect / Elco; Part Number: 04025A6R2CAT2A; Value: 6.2 pF
C?#24 = C_100P_0402_NP0_J_50: Part Number: GRM1555C1H101JZ01D; Manufacturer: Murata; Value: 100 pF
FB? = L_BEAD_102_0402: Chip Ferrite Bead, 0402, 1000Ω @ 100MHz, 1.1Ω, 25%, 250mA; Number of Circuits: 1; DC Resistance-Max: 1.1R; Impedance: 1kR; Material: Steel; Shielding: Unshielded; Number of Pins: 2; REACH SVHC: No SVHC; Case/Package: 0402; Core Material: Ferrite; Packaging: Tape and Reel; Max DC Current: 250mA; Test Frequency: 100MHz; Case Code (Metric): 1005; Height: 0.5mm; Military Standard: Not; Max Operating Temperature: 125°C; Termination: SMD/SMT; Tolerance: 25%; Length: 1mm; Number of Lines: 1; Min Operating Temperature: -55°C; Depth: 0.5mm; Case Code (Imperial): 0402; DC Current: 250mA; Contact Plating: Tin; Series: BLM15H; Radiation Hardening: No; Width: 0.5mm; DC Resistance (DCR): 1.1R; Max Current Rating: 250mA; Current Rating: 250mA; Package Quantity: 1; Lead Free: Lead Free; Frequency: 100MHz
J?#1 = CMP-17439-000358-1: CONN HEADER R/A 2POS 3.96MM; Max Current Rating: 10A; Max Voltage Rating (AC): 250V; Contact Resistance: 20mR; Number of Positions: 2; Housing Color: White; Packaging: Box; Termination: Solder; Number of Rows: 1; Length: 7.86mm; Orientation: Right Angle; Pitch: 3.96mm; Min Operating Temperature: -25°C; Contact Plating: Copper; Max Operating Temperature: 85°C; Lead Free: Lead Free; Housing Material: Polyamide; Contact Material: Brass
J?#2 = SMA-10V21-TGG: Rf Coax Conn, Sma Jack, 50 Ohm, Pcb Rohs Compliant: Yes |Wurth Elektronik 60312202114512; Impedance: 50Ω; Insulation Resistance: 5GΩ; Insertion Loss (dB): 0.14dB; Min Operating Temperature: -65°C; Max Operating Temperature: 165°C; Orientation: Straight; Connector Type: SMA; Insulation Material: PTFE
L?#1 L?#4 = L_27N_0402_J_LQW: Wire Wound RF Inductor 27nH ±5% 280mA 0.52Ω 0402 (1005); Test Frequency: 100MHz; DC Resistance (DCR): 520mR; Q Factor: 25; Self Resonant Frequency: 3.5GHz; Core Material: Air; Shielding: Unshielded; Mount: Surface Mount; Package Quantity: 10000; Max Operating Temperature: 125°C; Termination: SMD/SMT; Weight: 2.8E-05oz; Case Code (Metric): 1005; Radiation Hardening: No; Case Code (Imperial): 0402; Military Standard: Not; Packaging: Tape and Reel; Tolerance: 5%; Lead Free: Lead Free; Depth: 0.6mm; DC Current: 280mA; Inductance: 27nH; Current Rating: 280mA; Min Operating Temperature: -55°C; Width: 0.02inch; Height: 0.5mm; Length: 1mm; Max DC Current: 280mA; Case/Package: 0402; Resistor Type: Wirewound; Value: 27 nH
L?#2 L?#7 = L_56N_0402_J_LQW: Wire Wound RF Inductor 56nH ±5% 200mA 1.17Ω 0402 (1005); Test Frequency: 100MHz; Shielding: Unshielded; Self Resonant Frequency: 2.8GHz; Core Material: Air; Q Factor: 25; DC Resistance (DCR): 1.17R; Termination: SMD/SMT; Case Code (Imperial): 0402; Resistor Type: Wirewound; Mount: Surface Mount; Tolerance: 5%; Lead Free: Lead Free; Height: 0.5mm; Packaging: Tape and Reel; Min Operating Temperature: -55°C; Max DC Current: 200mA; Case/Package: 0402; Package Quantity: 10000; Military Standard: Not; Current Rating: 200mA; DC Current: 200mA; Inductance: 56nH; Depth: 0.6mm; Radiation Hardening: No; Case Code (Metric): 1005; Max Operating Temperature: 125°C; Length: 1mm; Weight: 2.8E-05oz; Width: 0.5mm; =Value: 56 nH
L?#3 L?#5 = L_15N_0402_J_LQW: Wire Wound RF Inductor 15nH ±5% 460mA 0.16Ω 0402 (1005); Test Frequency: 100MHz; DC Resistance (DCR): 160mR; Shielding: Unshielded; Q Factor: 30; Core Material: Air; Self Resonant Frequency: 5GHz; Resistor Type: Wirewound; DC Current: 460mA; Inductance: 15nH; Weight: 2.8E-05oz; Radiation Hardening: No; Depth: 0.7mm; Package Quantity: 10000; Case/Package: 0402; Packaging: Tape and Reel; Length: 1mm; Max DC Current: 460mA; Case Code (Imperial): 0402; Tolerance: 5%; Min Operating Temperature: -55°C; Lead Free: Lead Free; Width: 0.02inch; Case Code (Metric): 1005; Termination: SMD/SMT; Military Standard: Not; Current Rating: 460mA; Height: 0.5mm; Mount: Surface Mount; Max Operating Temperature: 125°C
L?#6 = L_43N_0402_J_LQW: Wire Wound RF Inductor 43nH ±5% 250mA 0.7Ω 0402 (1005); Test Frequency: 100MHz; Current: 145mA; Core Material: Air; Self Resonant Frequency: 3GHz; DC Resistance (DCR): 700mR; Shielding: Unshielded; Q Factor: 25; REACH SVHC: No SVHC; Case/Package: 0402; Package Quantity: 1; Termination: SMD/SMT; Max Operating Temperature: 125°C; Case Code (Imperial): 0402; Height: 0.5mm; DC Current: 250mA; Inductance Tolerance: 5%; Length: 1mm; Tolerance: 5%; Max DC Current: 250mA; Min Operating Temperature: -55°C; Depth: 0.6mm; Radiation Hardening: No; Inductance: 43nH; Military Standard: Not; Packaging: Tape and Reel; Current Rating: 250mA; Case Code (Metric): 1005; Width: 0.02inch; Weight: 2.8E-05oz; Mount: Surface Mount; Value: 43 nF
R?#1 = R_0_0402: RES 0 OHM JUMPER 0402; Power Rating: 1W; Tolerance: 5%; Temperature Coefficient: 200ppm/°C; Max Operating Temperature: 155°C; Case Code (Imperial): 0402; RoHS Compliant: Yes; Case Code (Metric): 1005; Construction: Rectangular; Series: RK73Z; Military Standard: Not; Resistance: 0mR; Package Quantity: 10000; Lead Free: Lead Free; Packaging: Tape and Reel; Case/Package: 0402; Resistor Type: Thick Film; Min Operating Temperature: -55°C; Width: 0.5mm; Depth: 0.5mm; Termination: SMD/SMT; Height: 0.35mm; Length: 1mm
R?#2 = R_18_0402_J: 18Ω ±5% 0.063W 0402 Thick Film Chip Resistor AEC-Q200 compliant; Max Power Dissipation: 63mW; Temperature Coefficient: 100ppm/°C; Lead Free: Lead Free; Resistor Type: Thick Film; Packaging: Tape and Reel; Tolerance: 5%; Resistance: 18R; Contact Plating: Tin; Mount: Surface Mount; Min Operating Temperature: -55°C; Case/Package: 0402; Case Code (Metric): 1005; Number of Terminations: 2; Series: RMCF; Length: 0.039inch; Width: 0.02inch; Height: 0.016inch; RoHS Compliant: Yes; Features: Automotive AEC-Q200; Max Operating Temperature: 155°C; Case Code (Imperial): 0402
R?#3 = R_56K_0402_F: Part Number: RK73H1ETTP5602F; Manufacturer: KOA Speer; Value: 56 Kohm
U? = CMP-04924-000017-1: IC RF TXRX+MCU ISM<1GHZ 32VFQFN; Min Supply Voltage: 2V; Max Frequency: 480MHz; Frequency: 960MHz; Sensitivity: -127dBm; Max Supply Voltage: 3.6V; Current - Receiving: 23mA; Number of Receivers: 1; Data Rate: 200Kbps; Current - Transmitting: 54mA; Interface: SPI; Min Frequency: 164MHz; Density: 0B; Output Power (dBm): 16dBm; RoHS Compliant: Yes; Package Quantity: 1; Lead Free: Lead Free; Number of Transmitters: 1; Max Operating Temperature: 85°C; REACH SVHC: No SVHC; Min Operating Temperature: -40°C; Radiation Hardening: No; Series: CC1120; Number of Pins: 32; Packaging: Tape and Reel; Case/Package: VQFN; Mount: Surface Mount
Y? = Crystal_32Mhz: Crystal 32MHz ±10ppm 6pF SMD-4 2.5mm x 2mm

## Nets that join several sheets
3V3: Computador_Abordo (12 pins), Comunicaciones (FB?.1 J?#1.2)
GND: Computador_Abordo (95 pins), Comunicaciones (30 pins)
GPIO0: Computador_Abordo (U6.2), Comunicaciones (U?.10)
GPIO2: Computador_Abordo (U6.3), Comunicaciones (U?.4)
GPIO3: Computador_Abordo (U6.4), Comunicaciones (U?.3)
RESET: Computador_Abordo (U6.5), Comunicaciones (U?.2)
SPI_CS: Computador_Abordo (U1.11), Comunicaciones (U?.11)
SPI_MISO: Computador_Abordo (U1.10), Comunicaciones (U?.9)
SPI_MOSI: Computador_Abordo (U1.13), Comunicaciones (U?.7)
SPI_SCK: Computador_Abordo (U1.12), Comunicaciones (U?.8)